# EasyEDA Pro project li-chuang-kai-fa-ban-li-chuang-esp32s3r8n8-kai-fa-ban-cb10375b.epro, schematic 立创ESP32S3R8N8开发板原理图

## Sheets
1 core: Board Name: 【立创ESP32S3R8N8开发板】V1.0.0; Create Date: 2024-02-28; Page Name: core; Project Name: 立创·ESP32S3R8N8开发板; Schematic Name: 立创ESP32S3R8N8开发板原理图; Update Date: 2024-09-14; Company: 嘉立创EDA; Page Size: A4; Reviewed: 嘉立创EDA
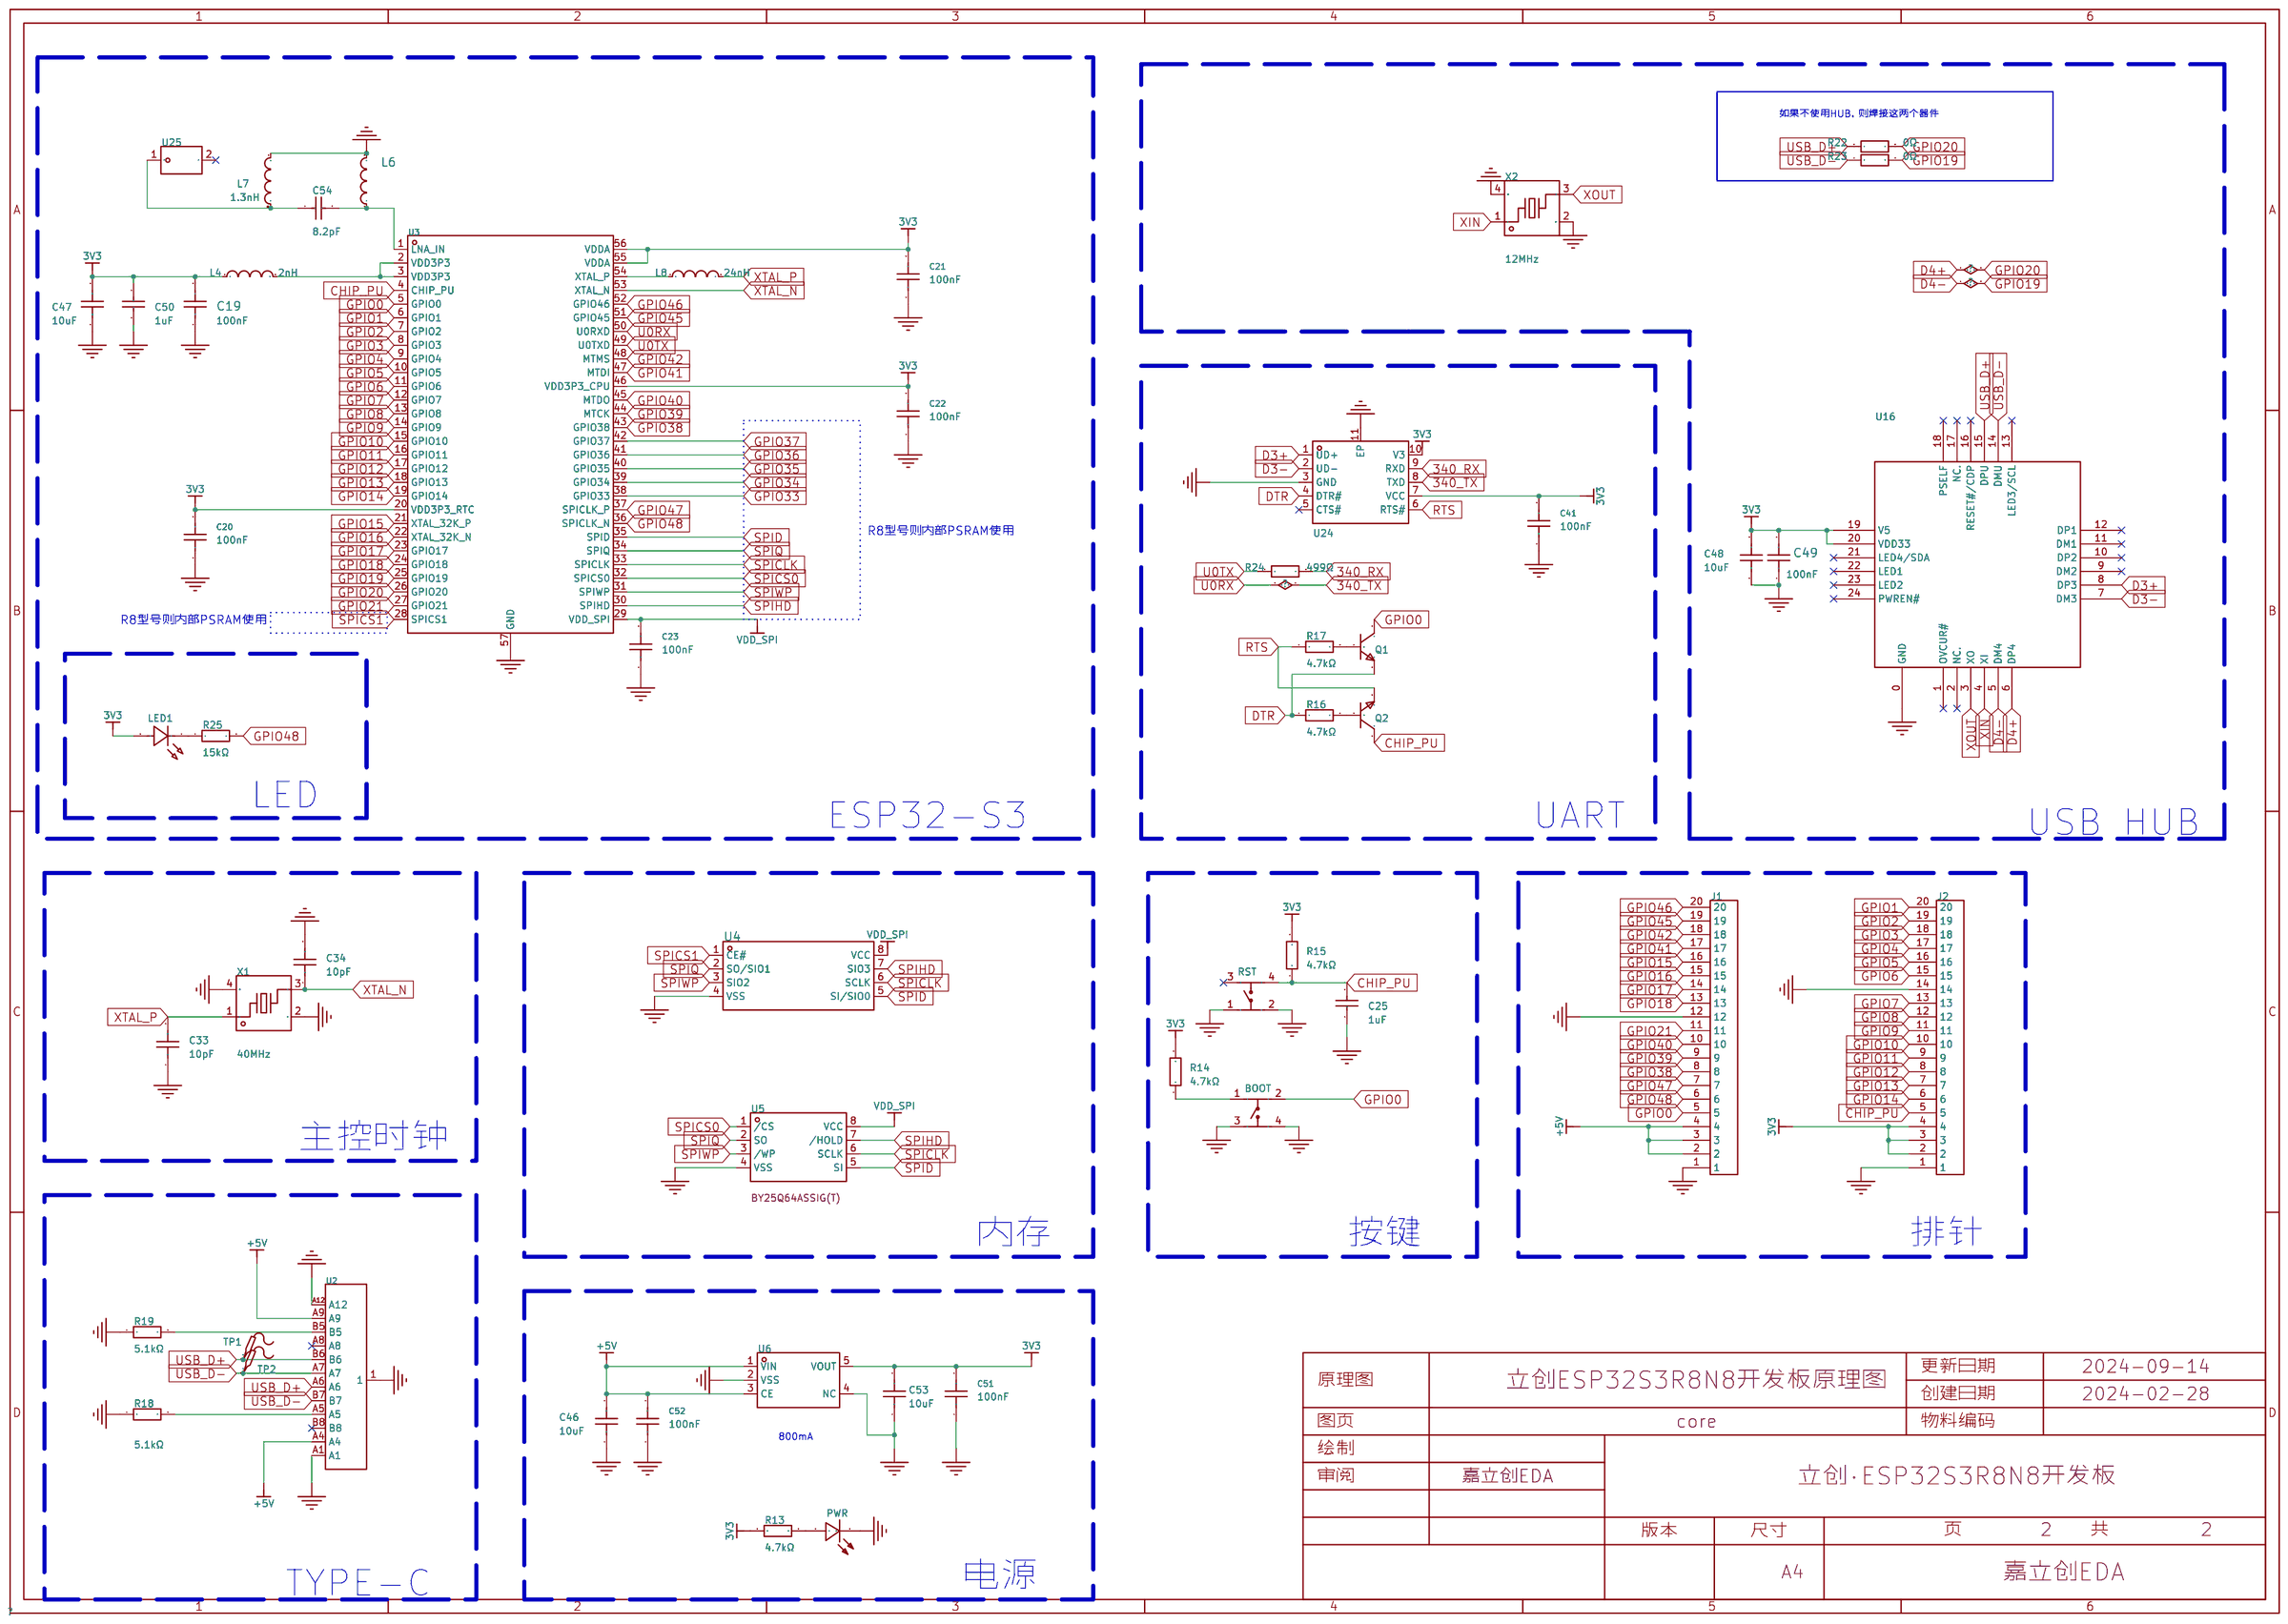
[diagram p0: core]
2 开源愿景: Page Name: 开源愿景; Update Date: 2024-03-07
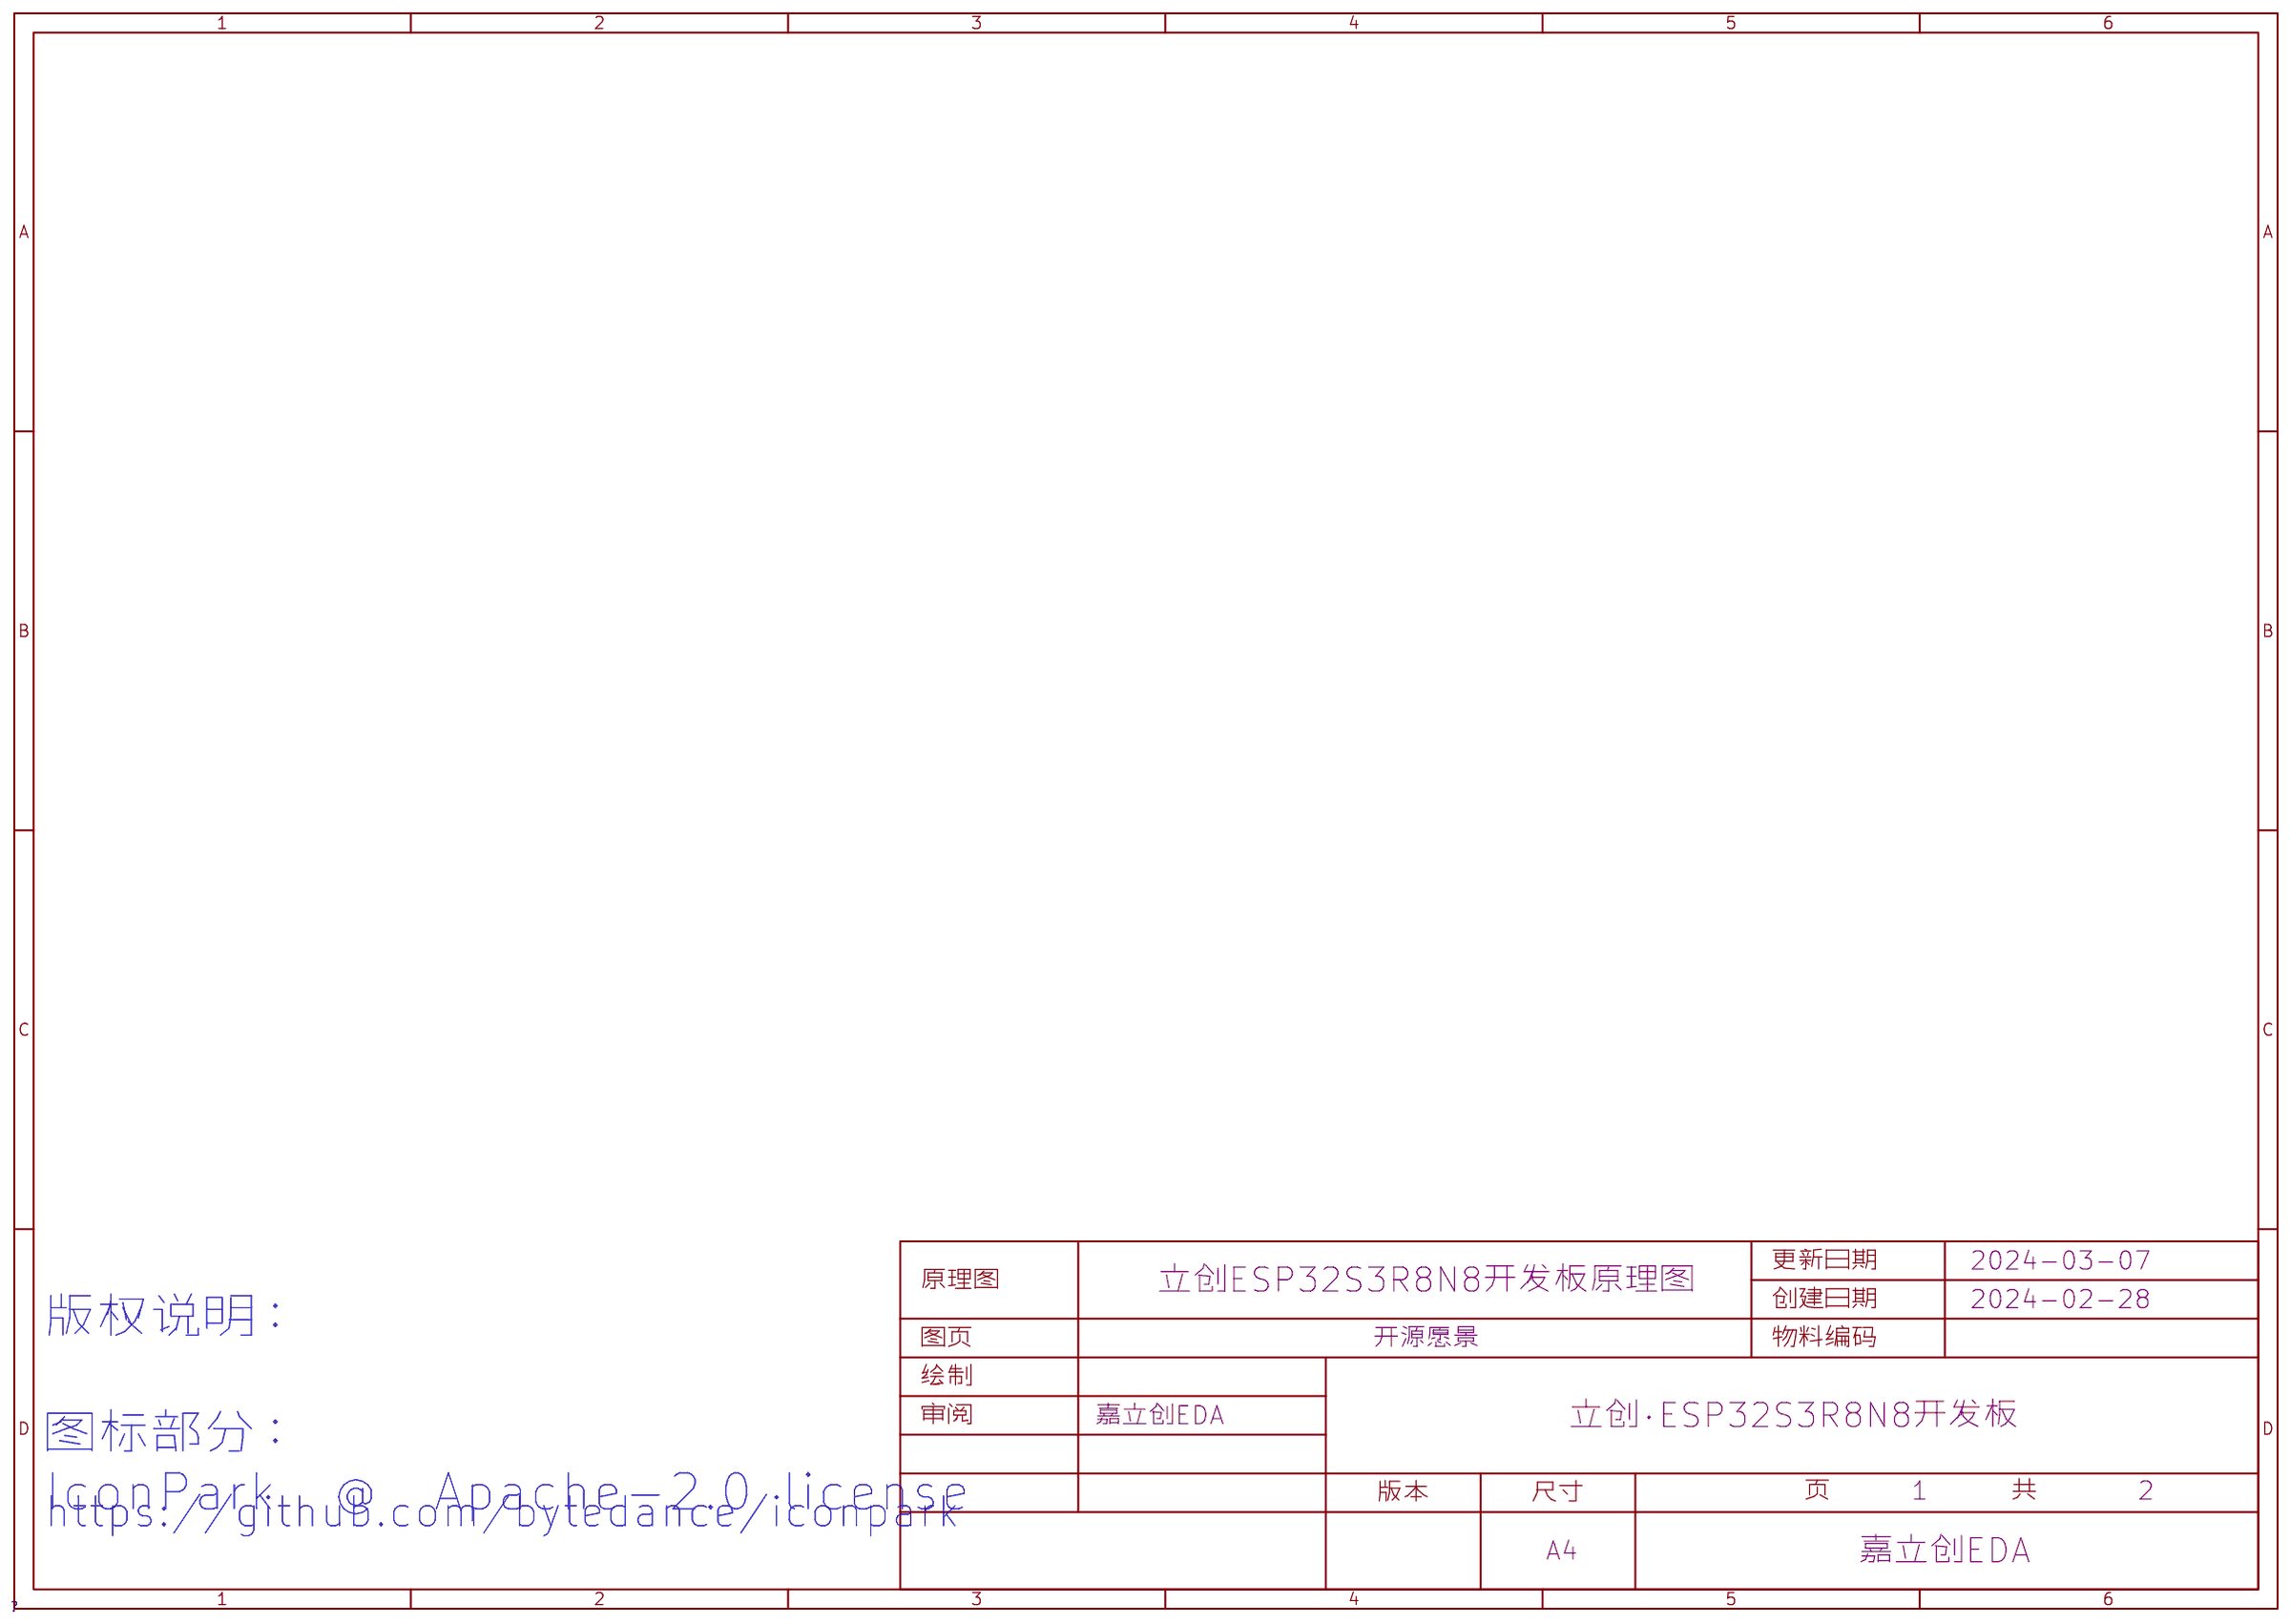
[diagram p1: 开源愿景]

## Parts
BOOT  TSA016A2518A  [KEY-SMD_4P-L4.2-W3.4-P2.15-LS4.5-TL]
C19  100nF  [R0402]
C20  100nF  [R0402]
C21  100nF  [R0402]
C22  100nF  [R0402]
C23  100nF  [R0402]
C25  1uF  [R0402]
C33  10pF  [R0402]
C34  10pF  [R0402]
C41  100nF  [R0402]
C46  10uF  [R0402]
C47  10uF  [R0402]
C48  10uF  [R0402]
C49  100nF  [R0402]
C50  1uF  [R0402]
C51  100nF  [R0402]
C52  100nF  [R0402]
C53  10uF  [R0402]
C54  8.2pF  [R0402]
J1  -  [半孔-孔-20P-2.54-1.27-无丝印]
J2  -  [半孔-孔-20P-2.54-1.27-无丝印]
L4  2nH  [R0402]
L6  39nH  [R0402]
L7  1.3nH  [R0402]
L8  24nH  [R0402]
LED1  XL-1005UGC  [LED0402-RD_GREEN]
PWR  NCD0402R1  [LED0402-RD]
Q1  MMBT3904T  [SOT-523_L1.6-W0.8-P1.00-BL]
Q2  MMBT3904T  [SOT-523_L1.6-W0.8-P1.00-BL]
R13  4.7kΩ  [R0402]
R14  4.7kΩ  [R0402]
R15  4.7kΩ  [R0402]
R16  4.7kΩ  [R0402]
R17  4.7kΩ  [R0402]
R18  5.1kΩ  [R0402]
R19  5.1kΩ  [R0402]
R22  0Ω  [R0402]
R23  0Ω  [R0402]
R24  499Ω  [R0402]
R25  15kΩ  [R0402]
RST  TSA016A2518A  [KEY-SMD_4P-L4.2-W3.4-P2.15-LS4.5-TL]
TP1  -  [Test-Point-0.5mm]
TP2  -  [Test-Point-0.5mm]
U2  USB-TYPE-C-019  [TYPE-C-SMD_HX-TYPE-C-16PIN]
U3  ESP32-S3(R8)  [QFN-56_L7.0-W7.0-P0.40-TL-EP4.0]
U4  -  [SOP-8_L5.3-W5.3-P1.27-LS8.0-BL]
U5  BY25Q64ASSIG(T)  [SOIC-8_L5.3-W5.3-P1.27-LS8.0-BL]
U6  ME6217C33M5G  [SOT-23-5_L3.0-W1.7-P0.95-LS2.8-BR]
U16  CH334F  [QFN24_4X4]
U24  CH340K  [ESOP-10_L4.9-W3.9-P1.00-LS6.2-BL-EP]
U25  RFANT5220110A0T  [FILTER-SMD_L5.2-W2.0-L]
X1  40MHz  [CRYSTAL-SMD_4P-L2.5-W2.0-BL]
X2  12MHz  [CRYSTAL-SMD_4P-L2.5-W2.0-BL-A]

## Library data of the parts
BOOT RST = TSA016A2518A: 触点电流:50mA;额定电压(AC):-;额定电压(DC):12V;安装方式:立贴;机械寿命:-;; LCSC Part Name: 4.2*3.35*2.5mm 立贴 轻触开关; Supplier Part: C2888427; Manufacturer: BZCN(博众电气); Supplier Footprint: SMD; JLCPCB Part Class: 扩展库; Datasheet: https://atta.szlcsc.com/upload/public/pdf/source/20210906/0198B859780D4FA617E4EB862D7350E5.pdf; Supplier: LCSC; Contact Current: 50mA; Voltage Rating (DC): 12V; Mounting Style: 立贴; Actuator Style: 椭圆形按钮; Switch Length: 4.2mm; Switch Width: 3.35mm; Switch Height: 2.5mm
C19-C23 C41 C49 C51 C52 = GRM155R71H104KE14D: 容值:100nF;精度:±10%;额定电压:50V;材质(温度系数):X7R;; LCSC Part Name: 100nF ±10% 50V; Supplier Part: C77020; Manufacturer: muRata(村田); Supplier Footprint: 0402; JLCPCB Part Class: 扩展库; Datasheet: https://atta.szlcsc.com/upload/public/pdf/source/20180326/C77020_39BD49C951FF1AF0DB1F1FAC5AC1E401.pdf; Supplier: LCSC; Tolerance: ±10%; Voltage Rated: 50V; Temperature Coefficient: X7R
C25 C50 = CL05A105KP5NNNC: 容值:1uF;精度:±10%;额定电压:10V;材质(温度系数):X5R;; LCSC Part Name: 1uF ±10% 10V; Supplier Part: C14445; Manufacturer: SAMSUNG(三星); Supplier Footprint: 0402; JLCPCB Part Class: 扩展库; Datasheet: https://atta.szlcsc.com/upload/public/pdf/source/20160103/1457707670698.pdf; Supplier: LCSC; Tolerance: ±10%; Voltage Rated: 10V; Temperature Coefficient: X5R
C33 C34 = CL05C100JB5NNNC: 容值:10pF;精度:±5%;额定电压:50V;材质(温度系数):C0G;; LCSC Part Name: 10pF ±5% 50V; Supplier Part: C32949; Manufacturer: SAMSUNG(三星); Supplier Footprint: 0402; JLCPCB Part Class: Basic Part; Datasheet: https://atta.szlcsc.com/upload/public/pdf/source/20160103/1457707722238.pdf; Supplier: LCSC; Tolerance: ±5%; Voltage Rated: 50V; Temperature Coefficient: C0G
C46-C48 C53 = GRM155R61A106ME44D: 容值:10uF;精度:±20%;额定电压:10V;材质(温度系数):X5R;; LCSC Part Name: 10uF ±20% 10V; Supplier Part: C77000; Manufacturer: muRata(村田); Supplier Footprint: 0402; JLCPCB Part Class: 扩展库; Datasheet: https://atta.szlcsc.com/upload/public/pdf/source/20180530/C77000_4866797CFE3A842CD03C597EBD6AE6CD.pdf; Supplier: LCSC; Tolerance: ±20%; Voltage Rated: 10V; Temperature Coefficient: X5R
C54 = 0402CG8R2C500NT: 容值:8.2pF;额定电压:50V;材质(温度系数):C0G;; LCSC Part Name: 8.2pF 50V ±0.25pF; Supplier Part: C1579; Manufacturer: FH(风华); Supplier Footprint: 0402; JLCPCB Part Class: 扩展库; Datasheet: https://atta.szlcsc.com/upload/public/pdf/source/20200305/C486355_26A10D38EF8C2A5C37091D0039909270.pdf; Supplier: LCSC; Voltage Rated: 50V; Temperature Coefficient: C0G
J1 J2 = 半孔-孔-20P-2.54-1.27-无丝印
L4 = MLG1005S2N0BT000: 电感值:2nH;精度:-;额定电流:900mA;饱和电流(Isat):-;直流电阻(DCR):70mΩ;; LCSC Part Name: 2nH ±0.1nH; Supplier Part: C76769; Manufacturer: TDK; Supplier Footprint: 0402; JLCPCB Part Class: Extended Part; Datasheet: https://atta.szlcsc.com/upload/public/pdf/source/20160918/1474166917976.pdf; Supplier: LCSC; Rated Current: 900mA; DC Resistance (DCR): 70mΩ; Q @ Freq: 7@100MHz; Frequency - Self Resonant: 7.5GHz
L6 = SDCL1005C39NJTDF: 电感值:39nH;额定电流:200mA;直流电阻(DCR):1Ω;精度:±5%;; Supplier Part: C26443; Manufacturer: Sunlord(顺络); Supplier Footprint: 0402; JLCPCB Part Class: 扩展库; Supplier: LCSC; Rated Current: 200mA; DC Resistance (DCR): 1Ω; Tolerance: ±5%
L7 = SDCL1005C1N3STDF: 电感值:1.3nH;精度:-;额定电流:400mA;直流电阻(DCR):100mΩ;饱和电流(Isat):-;; Supplier Part: C279756; Manufacturer: Sunlord(顺络); Supplier Footprint: 0402; JLCPCB Part Class: 扩展库; Datasheet: https://atta.szlcsc.com/upload/public/pdf/source/20231027/6126A3AAC5912C34388756BE22DEE00C.pdf; Supplier: LCSC; Rated Current: 400mA; DC Resistance (DCR): 100mΩ; Q @ Freq: 8@100MHz; Frequency - Self Resonant: 10GHz
L8 = SDCL1005C24NJTDF: 电感值:24nH;精度:±5%;额定电流:-;饱和电流(Isat):-;直流电阻(DCR):-;; LCSC Part Name: 24nH ±5%; Supplier Part: C74301; Manufacturer: Sunlord(顺络); Supplier Footprint: 0402; JLCPCB Part Class: 扩展库; Datasheet: https://atta.szlcsc.com/upload/public/pdf/source/20210916/2389196E6DC4CA1121B2D3610B126F46.pdf; Supplier: LCSC; Tolerance: ±5%
LED1 = XL-1005UGC: 发光颜色:翠绿;主波长:516nm;色温:-;功率:80mW;安装方式:正贴;; LCSC Part Name: 正贴; Supplier Part: C2856703; Manufacturer: XINGLIGHT(成兴光); Supplier Footprint: 0402; JLCPCB Part Class: Extended Part; Datasheet: https://atta.szlcsc.com/upload/public/pdf/source/20221102/FF8D6BC2225363A60A01D46BB802F217.pdf; Supplier: LCSC; Emitted Color: 翠绿; Lens Color: 无色透明; Dominant Wavelength: 516nm; Peak Wavelength: 531nm; Forward Current: 25mA; Power Dissipation: 80mW; Viewing Angle: 120°; Mounting Sytle: 正贴; Operating Temperature: -30℃~+85℃
PWR = NCD0402R1: 发光颜色:红灯;; LCSC Part Name: 红灯; Supplier Part: C130719; Manufacturer: 国星光电; Supplier Footprint: 0402; JLCPCB Part Class: Extended Part; Datasheet: https://atta.szlcsc.com/upload/public/pdf/source/20200820/C130719_A72EA5A7FEC83C35856EA0453E4EE775.pdf; Supplier: LCSC; Emitted Color: 红灯
Q1 Q2 = MMBT3904T_C2897486: 晶体管类型:NPN;集射极击穿电压(Vceo):40V;集电极电流(Ic):200mA;功率(Pd):150mW;集电极截止电流(Icbo):100nA;集电极-发射极饱和电压(VCE(sat)@Ic,Ib):300mV@50mA,5mA;直流电流增益(hFE@Ic,Vce):100@10mA,1V;特征频率(fT):300MHz;工作温度:-55℃~+150℃@(Tj);; LCSC Part Name: NPN 40V 200mA; Supplier Part: C2897486; Manufacturer: YONGYUTAI(永裕泰); Supplier Footprint: SOT-523; JLCPCB Part Class: 扩展库; Datasheet: https://atta.szlcsc.com/upload/public/pdf/source/20210915/C2897486_030617DA6C493917FD1A210D9F81156D.pdf; Supplier: LCSC; Transistor Type: NPN; Collector-Emitter Breakdown Voltage (Vceo): 40V; Collector Current (Ic): 200mA; Power Dissipation (Pd): 150mW; Collector Cut-Off Current (Icbo): 100nA; Collector-Emitter Saturation Voltage (VCE(sat)@Ic,Ib): 300mV@50mA,5mA; DC Current Gain (hFE@Ic,Vce): 100@10mA,1V; Transition Frequency (fT): 300MHz; Operating Temperature: -55℃~+150℃@(Tj)
R13-R17 = 0402WGJ0472TCE: 电阻类型:厚膜电阻;阻值:4.7kΩ;精度:±5%;功率:62.5mW;; LCSC Part Name: 4.7kΩ ±5% 62.5mW; Supplier Part: C25940; Manufacturer: UNI-ROYAL(厚声); Supplier Footprint: 0402; JLCPCB Part Class: 扩展库; Datasheet: https://atta.szlcsc.com/upload/public/pdf/source/20200306/C422600_1E6D84923E4A46A82E41ADD87F860B5C.pdf; Supplier: LCSC; Type: 厚膜电阻; Tolerance: ±5%; Power(Watts): 62.5mW; Temperature Coefficient: ±100ppm/℃; Overload Voltage (Max): 50V; Operating Temperature Range: -55℃~+155℃
R18 R19 = 0402WGF5101TCE: 电阻类型:厚膜电阻;阻值:5.1kΩ;精度:±1%;功率:62.5mW;; LCSC Part Name: 5.1kΩ ±1% 62.5mW; Supplier Part: C25905; Manufacturer: UNI-ROYAL(厚声); Supplier Footprint: 0402; JLCPCB Part Class: 基础库; Datasheet: https://atta.szlcsc.com/upload/public/pdf/source/20200306/C422600_1E6D84923E4A46A82E41ADD87F860B5C.pdf; Supplier: LCSC; Type: 厚膜电阻; Tolerance: ±1%; Power(Watts): 62.5mW; Temperature Coefficient: ±100ppm/℃; Overload Voltage (Max): 50V; Operating Temperature Range: -55℃~+155℃
R22 R23 = 0402WGF0000TCE: 电阻类型:厚膜电阻;阻值:0Ω;精度:±1%;功率:62.5mW;; LCSC Part Name: 0Ω ±1% 62.5mW; Supplier Part: C17168; Manufacturer: UNI-ROYAL(厚声); Supplier Footprint: 0402; JLCPCB Part Class: 基础库; Datasheet: https://atta.szlcsc.com/upload/public/pdf/source/20200306/C422600_1E6D84923E4A46A82E41ADD87F860B5C.pdf; Supplier: LCSC; Type: 厚膜电阻; Tolerance: ±1%; Power(Watts): 62.5mW; Temperature Coefficient: ±800ppm/℃; Overload Voltage (Max): 50V; Operating Temperature Range: -55℃~+155℃
R24 = 0402WGF4990TCE: 电阻类型:厚膜电阻;阻值:499Ω;精度:±1%;功率:62.5mW;; LCSC Part Name: 499Ω ±1% 62.5mW; Supplier Part: C4125; Manufacturer: UNI-ROYAL(厚声); Supplier Footprint: 0402; JLCPCB Part Class: Extended Part; Datasheet: https://atta.szlcsc.com/upload/public/pdf/source/20200306/C422600_1E6D84923E4A46A82E41ADD87F860B5C.pdf; Supplier: LCSC; Type: 厚膜电阻; Tolerance: ±1%; Power(Watts): 62.5mW; Temperature Coefficient: ±100ppm/℃; Overload Voltage (Max): 50V; Operating Temperature Range: -55℃~+155℃
R25 = 0402WGF1502TCE: 电阻类型:厚膜电阻;阻值:15kΩ;精度:±1%;功率:62.5mW;; LCSC Part Name: 15kΩ ±1% 62.5mW; Supplier Part: C25756; Manufacturer: UNI-ROYAL(厚声); Supplier Footprint: 0402; JLCPCB Part Class: Basic Part; Datasheet: https://atta.szlcsc.com/upload/public/pdf/source/20200306/C422600_1E6D84923E4A46A82E41ADD87F860B5C.pdf; Supplier: LCSC; Type: 厚膜电阻; Tolerance: ±1%; Power(Watts): 62.5mW; Temperature Coefficient: ±100ppm/℃; Overload Voltage (Max): 50V; Operating Temperature Range: -55℃~+155℃
TP1 TP2 = Test-Point: Test Point 测试点
U2 = USB-TYPE-C-019: Supplier Part: C2927039; Manufacturer: DEALON(德艺隆); Supplier Footprint: 插件; JLCPCB Part Class: 扩展库; Supplier: LCSC
U3 = ESP32-S3(R8): 应用领域:蓝牙,WiFi;频率范围:2.412GHz~2.484GHz;数据速率:150Mbps;灵敏度:-98.4dBm;接口:I2C,I2S,SPI,UART,USB;; Supplier Part: C2913194; Manufacturer: ESPRESSIF(乐鑫); Supplier Footprint: QFN-56(7x7); JLCPCB Part Class: 扩展库; Supplier: LCSC; Applications: 蓝牙,WiFi; Operating Voltage: 3.3V; Frequency Range: 2.412GHz~2.484GHz; Data Rate: 150Mbps; Sensitivity: -98.4dBm; Interface: I2C,I2S,SPI,UART,USB; Output Power: 21dBm; Operating Temperature: -40℃~+85℃
U4 = ESP-PSRAM64H: Supplier Part: C2763896; LCSC On Sale: 0; Supplier Footprint: SOP-8_3.9x4.9x1.27P; JLCPCB Part Class: Extended Part; JLCPCB Stock: 0; JLCPCB On Sale: 0; Datasheet: https://img.jlc.com//pdf/applyPasteComponent/2021-03-23/655146A/4bbd812cf7cc4d05988a6a0db8f7bb2a/PSRAM64H_datasheet_cn.pdf; Supplier: LCSC
U5 = BY25Q64ASSIG(T): Supplier Part: C484306; Manufacturer: BOYAMICRO(博雅); Supplier Footprint: SOIC-8-208mil; JLCPCB Part Class: 扩展库; Datasheet: https://atta.szlcsc.com/upload/public/pdf/source/20200115/C484306_247CE91A1CD6630E225A23B41696B60B.pdf; Supplier: LCSC
U6 = ME6217C33M5G: 输出类型:固定;输出极性:正;最大输入电压:7V;输出电压:3.3V;输出电流:800mA;电源纹波抑制比(PSRR):65dB@(1kHz);; Supplier Part: C427602; Manufacturer: MICRONE(南京微盟); Supplier Footprint: SOT-23-5; JLCPCB Part Class: 扩展库; Datasheet: https://atta.szlcsc.com/upload/public/pdf/source/20190910/C427602_D4B9162A2E9D9EF57C60010DFDECEF37.pdf; Supplier: LCSC; Output Type: 固定; Output Polarity: 正; Number of Outputs: 1; Maximum Input Voltage: 7V; Output Voltage: 3.3V; Dropout Voltage: 180mV@(300mA); Output Current: 800mA; Power Supply Rejection Ratio (PSRR): 65dB@(1kHz)
U16 = CH334F
U24 = CH340K: 应用功能:-;接口协议:-;; LCSC Part Name: CH340K USB转串口芯片 CH340; Supplier Part: C968586; Manufacturer: WCH(南京沁恒); Supplier Footprint: ESOP-10-EP-150mil; JLCPCB Part Class: 扩展库; Datasheet: https://atta.szlcsc.com/upload/public/pdf/source/20200819/C84681_ADBED554CE321879DBD6B1D06488689C.pdf; Supplier: LCSC
U25 = RFANT5220110A0T: 2.4 GHz 陶瓷天线; Supplier Part: C127611; Manufacturer: Walsin(华新科); Supplier Footprint: SMD,2x5.2mm; JLCPCB Part Class: 扩展库; Datasheet: https://atta.szlcsc.com/upload/public/pdf/source/20180326/C127611_CAA3DCCF3A021118096CAD99FC50242A.pdf; Supplier: LCSC
X1 = S2240000101050JY: 频率:40MHz;频率公差:±10ppm;负载电容:10pF;; LCSC Part Name: 40MHz ±10ppm 内置负载电容:10pF; Supplier Part: C2885592; Manufacturer: JGHC(晶光华); Supplier Footprint: SMD2520-4P; JLCPCB Part Class: 扩展库; Datasheet: https://atta.szlcsc.com/upload/public/pdf/source/20191012/C426971_E72B01839CFBB8D8B48FED2AC1315BE2.pdf; Supplier: LCSC; Crystal Type: 贴片无源晶振; Frequency Tolerance: ±10ppm; Load Capacitance: 10pF; Equivalent Series Resistance (ESR): 50Ω; Operating Temperature: -40℃~+85℃
X2 = X252012MMB4SI-24: 频率:12MHz;频率公差:±10ppm;负载电容:10pF;; LCSC Part Name: 12MHz ±10ppm 10pF YSX221SL; Supplier Part: C2896601; Manufacturer: YXC(扬兴晶振); Supplier Footprint: SMD2520-4P; JLCPCB Part Class: 扩展库; Datasheet: https://atta.szlcsc.com/upload/public/pdf/source/20210917/7E0AFFDD74AE514FE25E1ADDD9E3C073.pdf; Supplier: LCSC; Crystal Type: 贴片无源晶振; Frequency Tolerance: ±10ppm; Frequency Stability: ±20ppm; Load Capacitance: 10pF; Operating Temperature: -40℃~+85℃

## Nets
3V3: C19.2 C20.2 C21.2 C22.2 C41.2 C47.2 C48.2 C49.2 C50.2 C51.2 C53.2 J2.2 J2.3 J2.4 L4.1 LED1.2(A) R13.1 R14.2 R15.2 U3.20(VDD3P3_RTC) U3.46(VDD3P3_CPU) U3.55(VDDA) U3.56(VDDA) U6.5(VOUT) U16.19(V5) U16.20(VDD33) U24.7(VCC) U24.10(V3)
+5V: C46.2 C52.2 J1.2 J1.3 J1.4 U2.A4 U2.A9 U6.1(VIN) U6.3(CE)
GND: BOOT.3 BOOT.4 C19.1 C20.1 C21.1 C22.1 C23.1 C25.1 C33.1 C34.2 C41.1 C46.1 C47.1 C48.1 C49.1 C50.1 C51.1 C52.1 C53.1 J1.1 J1.12 J2.1 J2.14 L6.2 L7.2 PWR.1(K) R18.1 R19.1 RST.1 RST.2 U2.1 U2.A1 U2.A12 U3.57(GND) U4.4(VSS) U5.4(VSS) U6.2(VSS) U6.4(NC) U16.0(GND) U24.3(GND) U24.11(EP) X1.2(GND) X1.4(GND) X2.2(GND) X2.4(GND)
VDD_SPI: C23.2 U3.29(VDD_SPI) U4.8(VCC) U5.8(VCC)
340_RX: R24.2 U24.9(RXD)
340_TX: U3.50(U0RXD) U24.8(TXD)
CHIP_PU: C25.2 J2.5 Q2.3(C) R15.1 RST.4 U3.4(CHIP_PU)
D3+: U16.8(DP3) U24.1(UD+)
D3-: U16.7(DM3) U24.2(UD-)
D4+: R22.2 U3.26(GPIO20) U16.6(DP4)
D4-: R23.2 U3.25(GPIO19) U16.5(DM4)
DTR: Q1.2(E) R16.1 U24.4(DTR#)
GPIO0: BOOT.2 J1.5 Q1.3(C) U3.5(GPIO0)
GPIO1: J2.20 U3.6(GPIO1)
GPIO2: J2.19 U3.7(GPIO2)
GPIO3: J2.18 U3.8(GPIO3)
GPIO4: J2.17 U3.9(GPIO4)
GPIO5: J2.16 U3.10(GPIO5)
GPIO6: J2.15 U3.11(GPIO6)
GPIO7: J2.13 U3.12(GPIO7)
GPIO8: J2.12 U3.13(GPIO8)
GPIO9: J2.11 U3.14(GPIO9)
GPIO10: J2.10 U3.15(GPIO10)
GPIO11: J2.9 U3.16(GPIO11)
GPIO12: J2.8 U3.17(GPIO12)
GPIO13: J2.7 U3.18(GPIO13)
GPIO14: J2.6 U3.19(GPIO14)
GPIO15: J1.16 U3.21(XTAL_32K_P)
GPIO16: J1.15 U3.22(XTAL_32K_N)
GPIO17: J1.14 U3.23(GPIO17)
GPIO18: J1.13 U3.24(GPIO18)
GPIO21: J1.11 U3.27(GPIO21)
GPIO33: U3.38(GPIO33)
GPIO34: U3.39(GPIO34)
GPIO35: U3.40(GPIO35)
GPIO36: U3.41(GPIO36)
GPIO37: U3.42(GPIO37)
GPIO38: J1.8 U3.43(GPIO38)
GPIO39: J1.9 U3.44(MTCK)
GPIO40: J1.10 U3.45(MTDO)
GPIO41: J1.17 U3.47(MTDI)
GPIO42: J1.18 U3.48(MTMS)
GPIO45: J1.19 U3.51(GPIO45)
GPIO46: J1.20 U3.52(GPIO46)
GPIO47: J1.7 U3.37(SPICLK_P)
GPIO48: J1.6 R25.2 U3.36(SPICLK_N)
RTS: Q2.2(E) R17.1 U24.6(RTS#)
SPICLK: U3.33(SPICLK) U4.6(SCLK) U5.6(SCLK)
SPICS0: U3.32(SPICS0) U5.1(/CS)
SPICS1: U3.28(SPICS1) U4.1(CE#)
SPID: U3.35(SPID) U4.5(SI/SIO0) U5.5(SI)
SPIHD: U3.30(SPIHD) U4.7(SIO3) U5.7(/HOLD)
SPIQ: U3.34(SPIQ) U4.2(SO/SIO1) U5.2(SO)
SPIWP: U3.31(SPIWP) U4.3(SIO2) U5.3(/WP)
U0TX: R24.1 U3.49(U0TXD)
USB_D+: R22.1 TP1.1 U2.A6 U2.B6 U16.15(DPU)
USB_D-: R23.1 TP2.1 U2.A7 U2.B7 U16.14(DMU)
XIN: U16.4(XI) X2.1
XOUT: U16.3(XO) X2.3
XTAL_N: C34.1 U3.53(XTAL_N) X1.3
XTAL_P: C33.2 L8.2 X1.1
$1N4043: R19.2 U2.B5
$1N4044: R18.2 U2.A5
$1N4117: BOOT.1 R14.1
$1N4141: PWR.2(A) R13.2
$1N4145: Q2.1(B) R16.2
$1N4146: Q1.1(B) R17.2
$1N12244: LED1.1(K) R25.1
$1N15135: L4.2 U3.2(VDD3P3) U3.3(VDD3P3)
$1N27024: C54.2 L6.1 U3.1(LNA_IN)
$1N27033: C54.1 L7.1 U25.1
$1N27209: L8.1 U3.54(XTAL_P)

Not connected (* = marked no-connect by the designer): RST 3*; U2 A8* B8*; U16 1(OVCUR#)* 2(NC.)* 9(DM2)* 10(DP2)* 11(DM1)* 12(DP1)* 13(LED3/SCL)* 16(RESET#/CDP)* 17(NC.)* 18(PSELF)* 21(LED4/SDA)* 22(LED1)* 23(LED2)* 24(PWREN#)*; U24 5(CTS#)*; U25 2*

## Notes on the sheets
sheet 1
- 如果不使用HUB，则焊接这两个器件
- R8型号则内部PSRAM使用
- R8型号则内部PSRAM使用
- LED
- ESP32-S3
- UART
- USB HUB
- 主控时钟
- 内存
- 按键
- 排针
- 800mA
- TYPE-C
- 电源
sheet 2
- 版权说明：
  图标部分：
  IconPark  @  Apache-2.0 license
- https://github.com/bytedance/iconpark
